# Altium schematic sheet POWER_SUPPLY.SchDoc
size A4; SheetNumber: 4; SheetTotal: 6
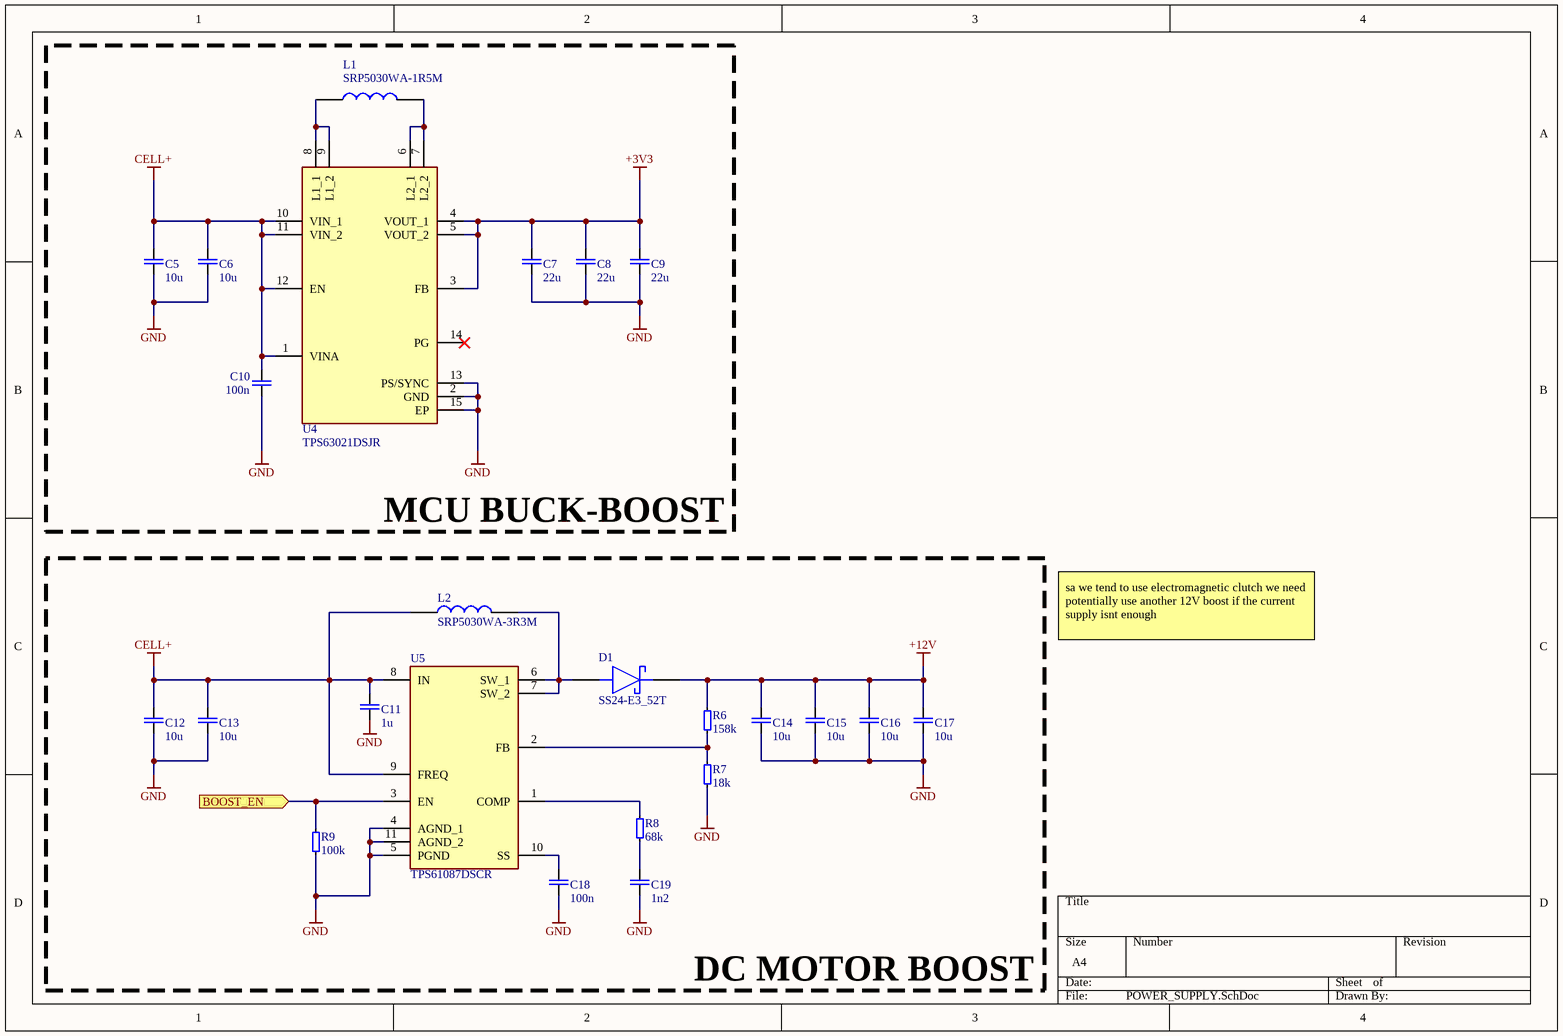
[diagram p0: POWER_SUPPLY.SchDoc]

## Parts
C5  10u  [C0805]
C6  10u  [C0805]
C7  22u  [C1206]
C8  22u  [C1206]
C9  22u  [C1206]
C10  100n  [C0402]
C11  1u  [C0603]
C12  10u  [C0805]
C13  10u  [C0805]
C14  10u  [C1206]
C15  10u  [C1206]
C16  10u  [C1206]
C17  10u  [C1206]
C18  100n  [C0402]
C19  1n2  [C0402]
D1  SS24-E3_52T  [DIOM5436X244N]
L1  SRP5030WA-1R5M  [INDPM5552X300N]
L2  SRP5030WA-3R3M  [INDPM5552X300N]
R6  158k  [R0402]
R7  18k  [R0402]
R8  68k  [R0402]
R9  100k  [R0402]
U4  TPS63021DSJR  [SON50P300X400X100-15N-D]
U5  TPS61087DSCR  [SON50P300X300X80-11N-D]

## Blocks framed on the sheet
MCU BUCK-BOOST: C5-C10 L1 U4
DC MOTOR BOOST: C11-C19 D1 L2 R6-R9 U5

## Ports
BOOST_EN (in)

## Nets
+3V3: C7.2 C8.2 C9.2 U4.3(FB) U4.4(VOUT_1) U4.5(VOUT_2)
+12V: C14.2 C15.2 C16.2 C17.2 D1.1(K) R6.2
CELL+: C5.2 C6.2 C10.2 C11.2 C12.2 C13.2 L2.1 U4.1(VINA) U4.10(VIN_1) U4.11(VIN_2) U4.12(EN) U5.8(IN) U5.9(FREQ)
GND: C5.1 C6.1 C7.1 C8.1 C9.1 C10.1 C11.1 C12.1 C13.1 C14.1 C15.1 C16.1 C17.1 C18.1 C19.1 R7.1 R9.1 U4.2(GND) U4.13(PS/SYNC) U4.15(EP) U5.4(AGND_1) U5.5(PGND) U5.11(AGND_2)
BOOST_EN: R9.2 U5.3(EN) ; port BOOST_EN
NetC18_2: C18.2 U5.10(SS)
NetC19_2: C19.2 R8.1
NetD1_2: D1.2(A) L2.2 U5.6(SW_1) U5.7(SW_2)
NetL1_1: L1.1 U4.8(L1_1) U4.9(L1_2)
NetL1_2: L1.2 U4.6(L2_1) U4.7(L2_2)
NetR6_1: R6.1 R7.2 U5.2(FB)
NetR8_2: R8.2 U5.1(COMP)

Not connected (* = marked no-connect by the designer): U4 14(PG)*

## Notes on the sheet
- sa we tend to use electromagnetic clutch we need potentially use another 12V boost if the current supply isnt enough

## Library data of the parts
C5 C6 C12 C13 = CMP-00025-5: Generic 0805 SMD Ceramic Capacitor
C7-C9 C14-C17 = CMP-00026-7: Generic 1206 SMD Ceramic Capacitor
C10 C18 C19 = CMP-00023-15: Generic SMD 0402 Ceramic Capacitor
C11 = CMP-00024-8: Generic 0603 SMD Ceramic Capacitor
D1 = SS24-E3_52T: Schottky Diodes & Rectifiers 2.0 Amp 40 Volt; Manufacturer_Name: Vishay; Manufacturer_Part_Number: SS24-E3/52T; Geometry.Height: 2.44mm; Mouser Part Number: 625-SS24-E3; Mouser Price/Stock: https://www.mouser.co.uk/ProductDetail/Vishay-General-Semiconductor/SS24-E3-52T?qs=x2jpVgRnAtP8XbmaoIr%252Bng%3D%3D; Datasheet Link: https://www.vishay.com/docs/88748/ss22.pdf
L1 = SRP5030WA-1R5M: Ind,5.5x5.25x2.8mm,1.5uH+/-20%,8.5A,shd; Manufacturer_Name: Bourns; Geometry.Height: 3mm; Mouser Part Number: 652-SRP5030WA-1R5M; Mouser Price/Stock: https://www.mouser.co.uk/ProductDetail/Bourns/SRP5030WA-1R5M?qs=9vOqFld9vZVU1hSpR6NGrg%3D%3D; Manufacturer_Part_Number: SRP5030WA-1R5M; Datasheet Link: https://g.componentsearchengine.com/Datasheets/0/17601778.pdf
L2 = SRP5030WA-3R3M: Ind,5.5x5.25x2.8mm,3.3uH+/-20%,6A,shd; Manufacturer_Name: Bourns; Geometry.Height: 3mm; Mouser Part Number: 652-SRP5030WA-3R3M; Mouser Price/Stock: https://www.mouser.co.uk/ProductDetail/Bourns/SRP5030WA-3R3M?qs=9vOqFld9vZVo7qWb%252BEg6NA%3D%3D; Manufacturer_Part_Number: SRP5030WA-3R3M; Datasheet Link: https://www.bourns.com/docs/Product-Datasheets/SRP5030WA.pdf
R6-R9 = CMP-00016-11: Generic 0402 SMD Resistor
U4 = TPS63021DSJR: High Efficiency Single Inductor Buck-Boost Converter with 4A Switch; Manufacturer_Name: Texas Instruments; Geometry.Height: 1mm; Mouser Part Number: 595-TPS63021DSJR; Mouser Price/Stock: https://www.mouser.co.uk/ProductDetail/Texas-Instruments/TPS63021DSJR?qs=C44r%252BX3hXgL5uT9uesn8fg%3D%3D; Manufacturer_Part_Number: TPS63021DSJR; Datasheet Link: http://www.ti.com/lit/gpn/tps63021
U5 = TPS61087DSCR: Conv DC-DC 2.5V to 6V Non-Inv/Inv/Step Up/Step Down Single-Out 3V to 18.5V 3.2A 10-Pin WSON EP T/R; Manufacturer_Name: Texas Instruments; Geometry.Height: 0.8mm; Mouser Part Number: 595-TPS61087DSCR; Mouser Price/Stock: https://www.mouser.co.uk/ProductDetail/Texas-Instruments/TPS61087DSCR?qs=bS0R8qMSxJOWmsgAbsl9FQ%3D%3D; Manufacturer_Part_Number: TPS61087DSCR; Datasheet Link: http://www.ti.com/lit/gpn/tps61087